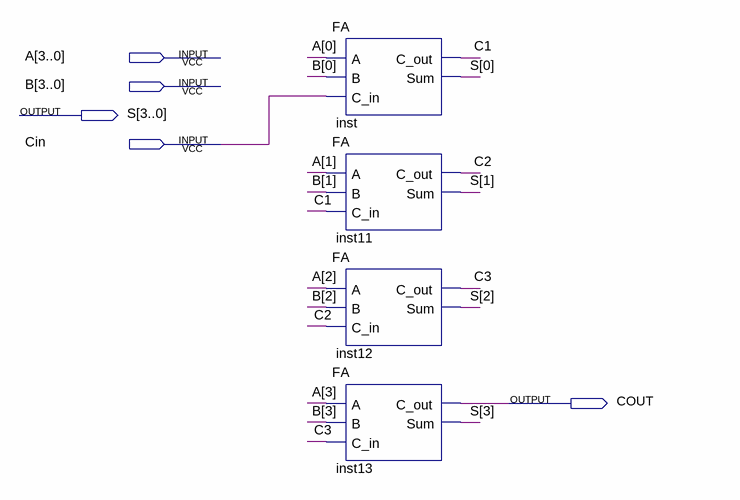
[diagram p0: schematic sheet]
// Quartus schematic 4bit-FA.bdf as structural Verilog: 4 symbols, 5 pins
module \4bit-FA  (
  input  [3:0] A,
  input  [3:0] B,
  input  Cin,
  output [3:0] S,
  output COUT
);

  wire C1, C2, C3;

  FA inst (.A(A[0]), .B(B[0]), .C_in(Cin), .C_out(C1), .Sum(S[0]));
  FA inst11 (.A(A[1]), .B(B[1]), .C_in(C1), .C_out(C2), .Sum(S[1]));
  FA inst12 (.A(A[2]), .B(B[2]), .C_in(C2), .C_out(C3), .Sum(S[2]));
  FA inst13 (.A(A[3]), .B(B[3]), .C_in(C3), .C_out(COUT), .Sum(S[3]));
endmodule
